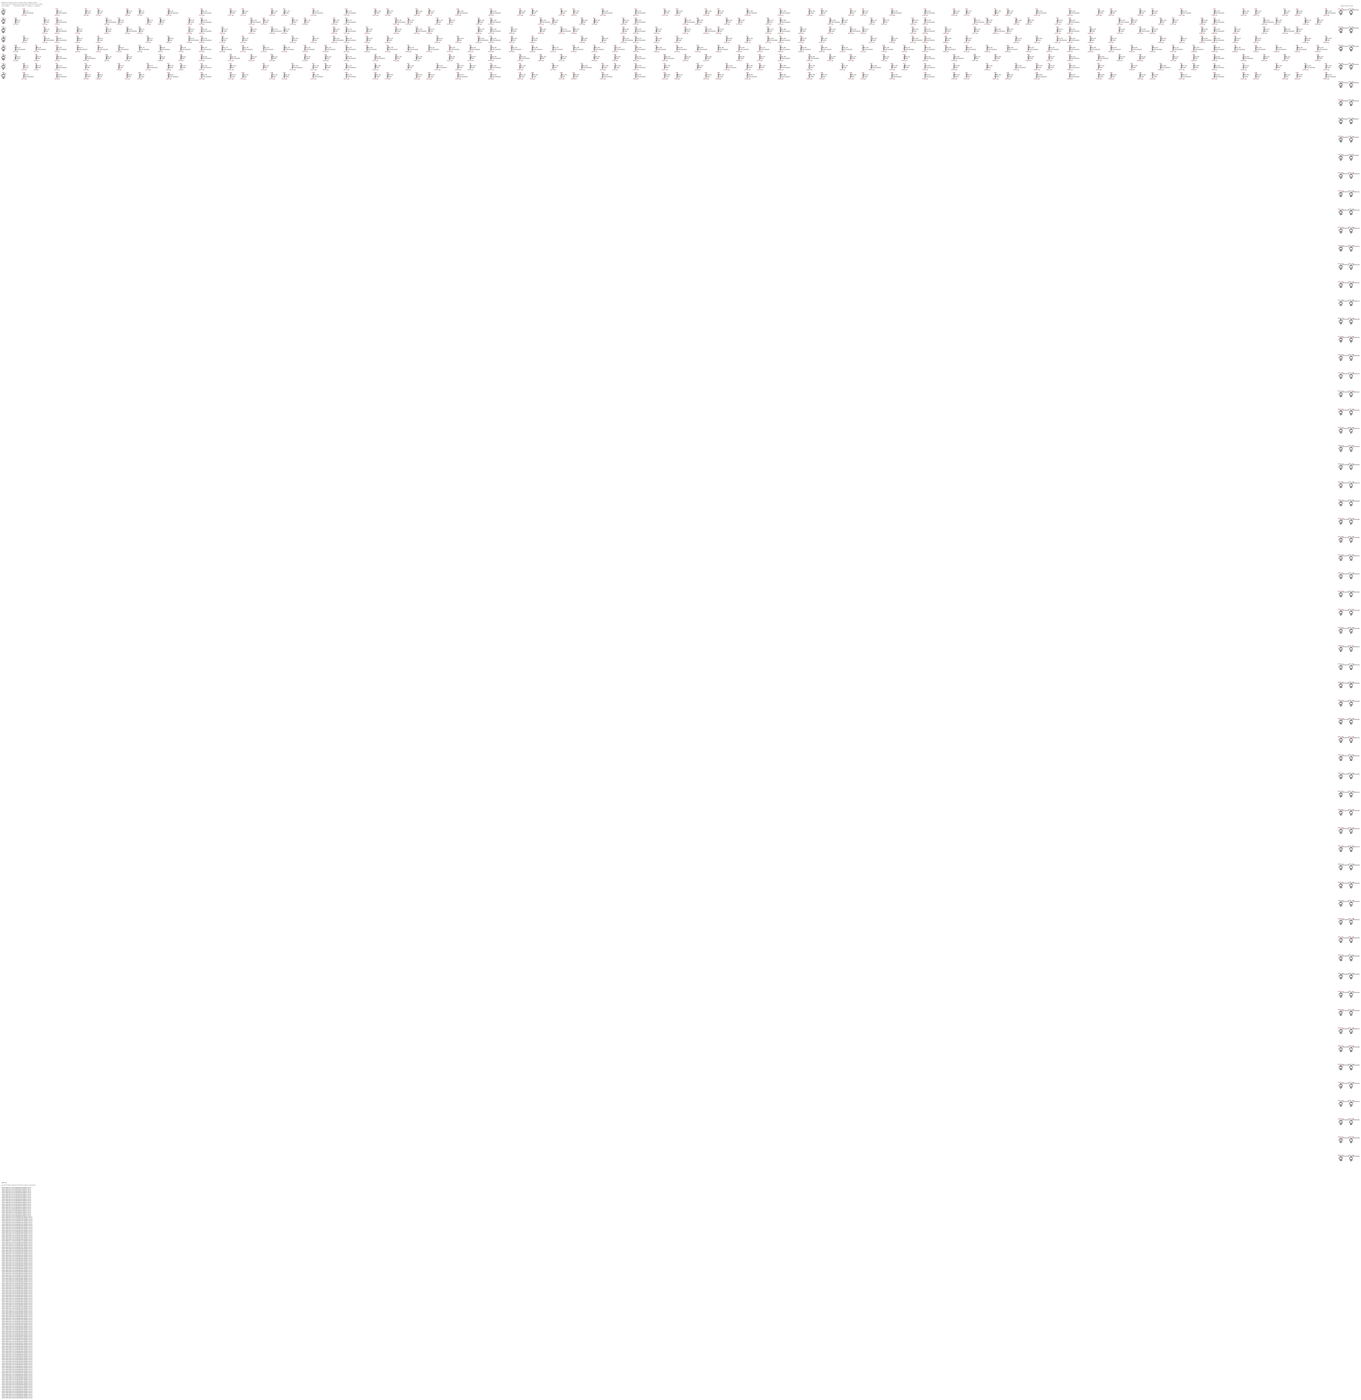
[diagram p0: schematic crossbar_differential.asc, whole sheet]
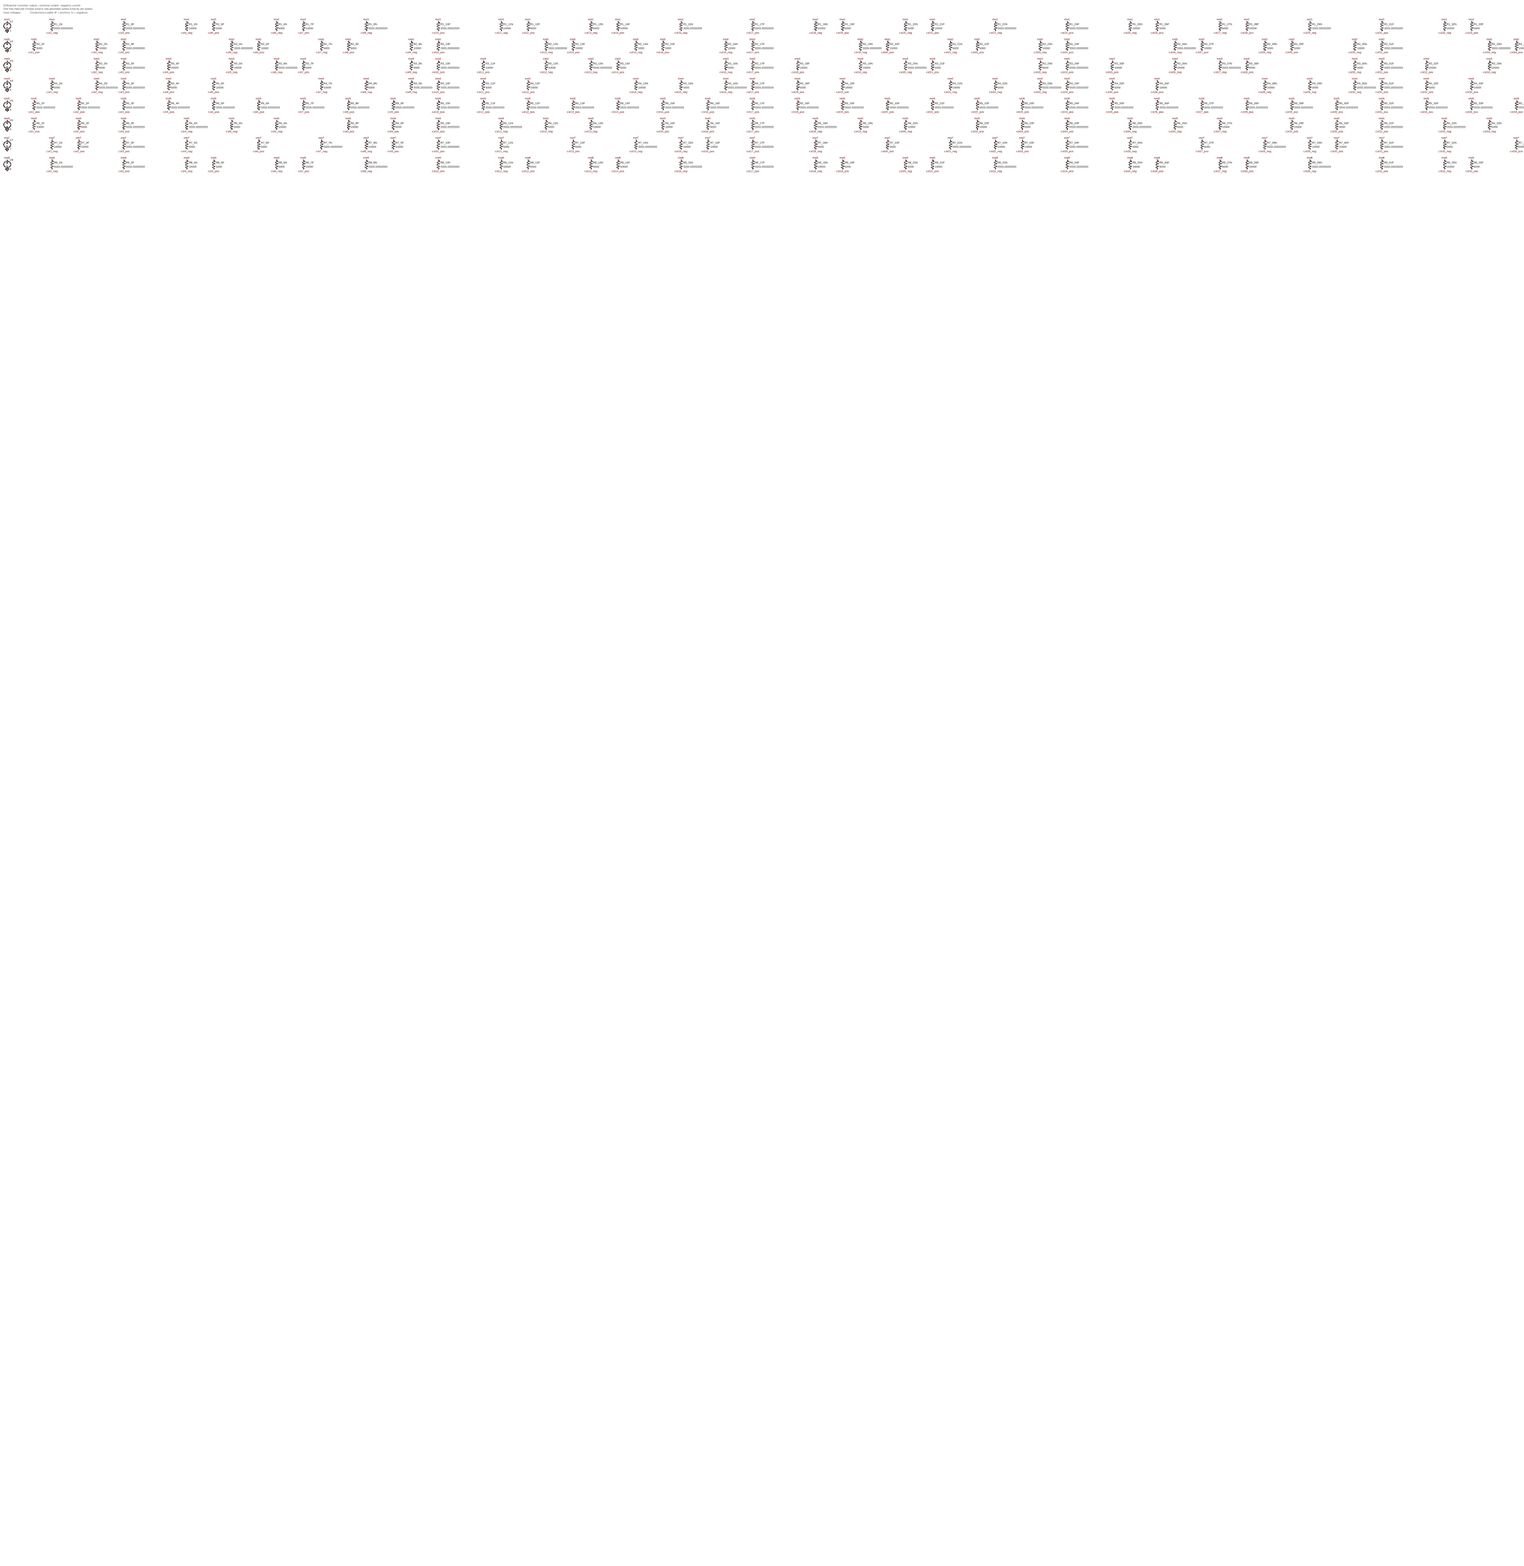
[diagram p1: schematic crossbar_differential.asc, part, row 1 of 2, column 1 of 2]
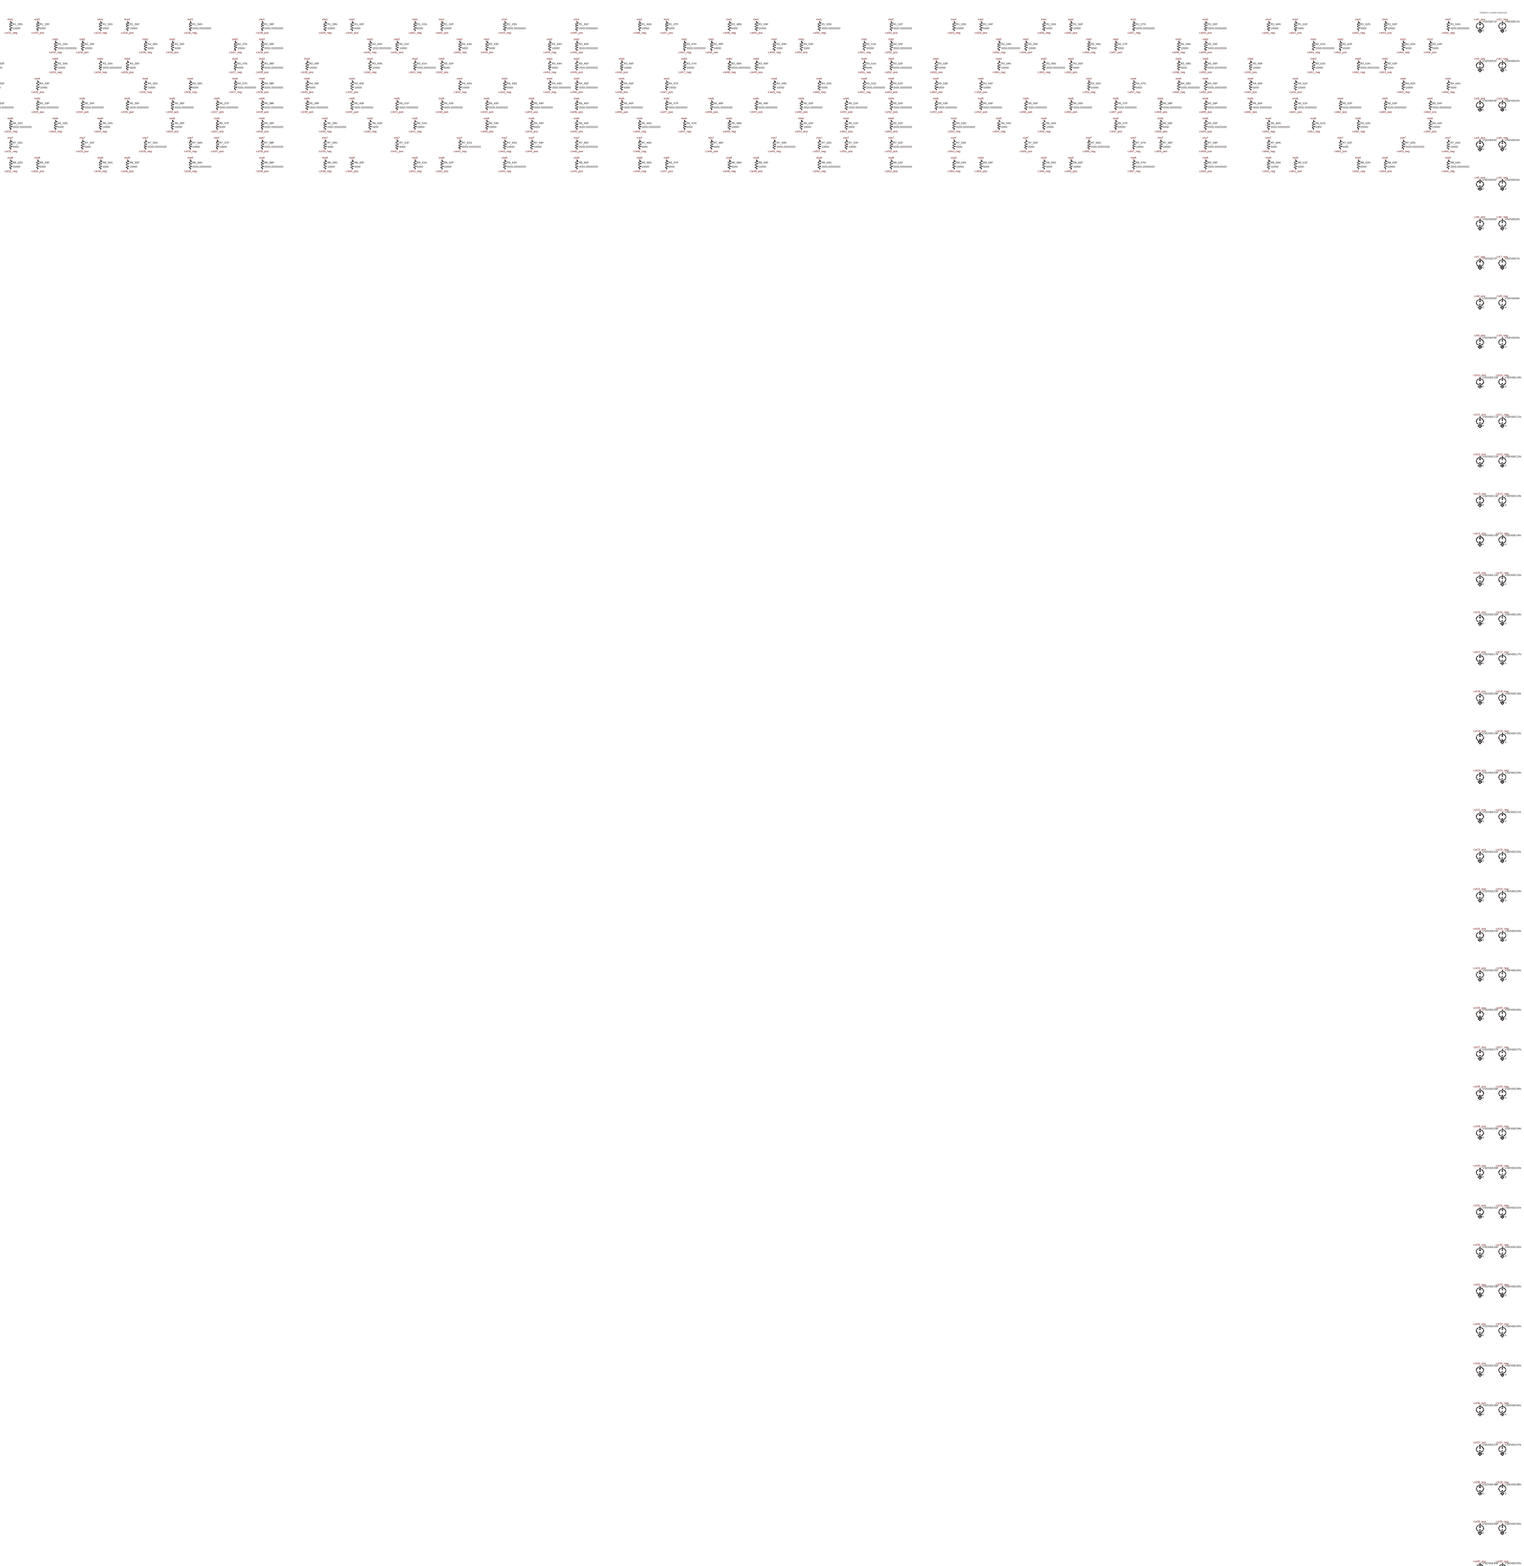
[diagram p2: schematic crossbar_differential.asc, part, row 1 of 2, column 2 of 2]
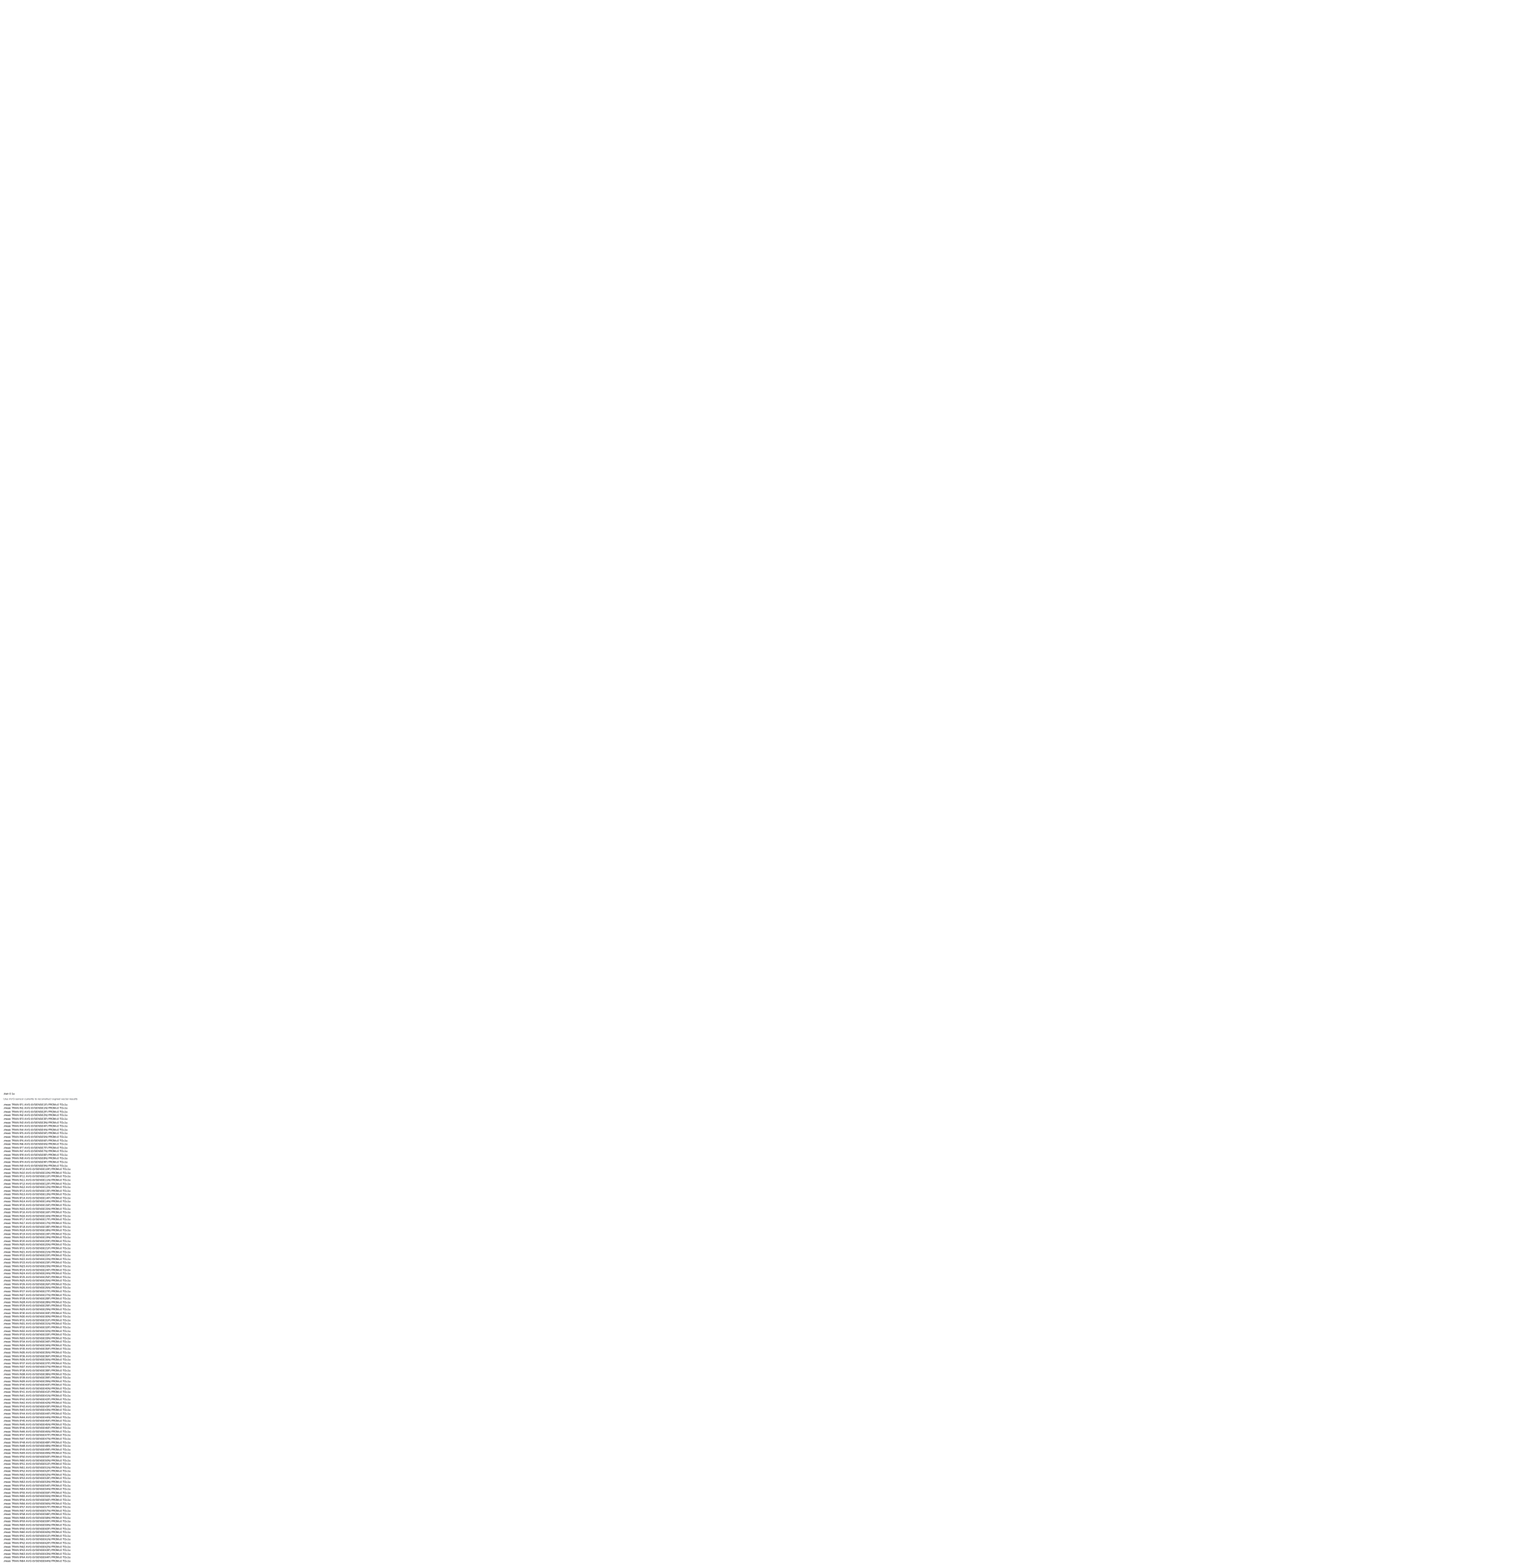
[diagram p3: schematic crossbar_differential.asc, part, row 2 of 2, column 1 of 2]
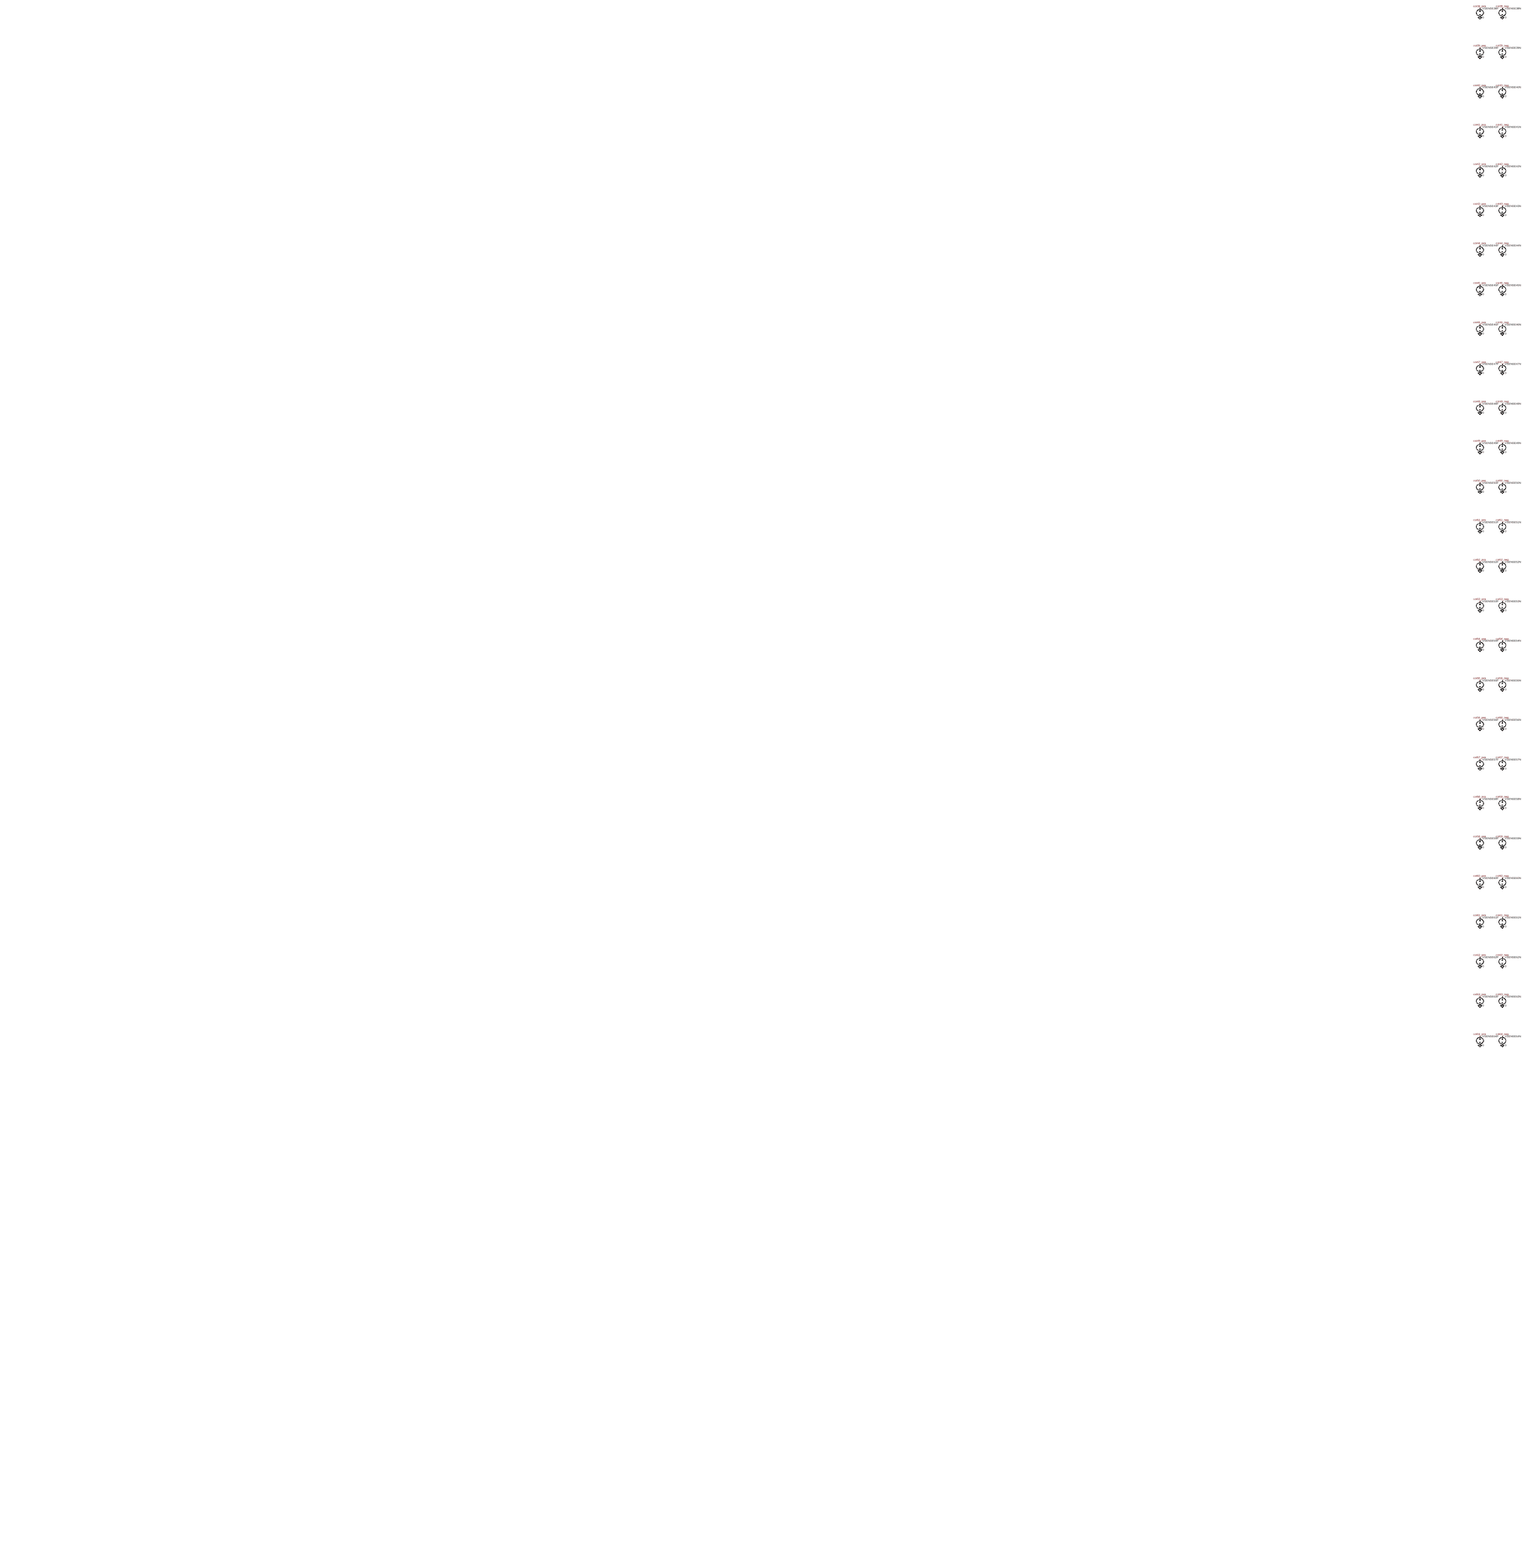
[diagram p4: schematic crossbar_differential.asc, part, row 2 of 2, column 2 of 2]
* crossbar_differential.asc
V1 row1 0 1
V2 row2 0 2
V3 row3 0 3
V4 row4 0 4
V5 row5 0 5
V6 row6 0 6
V7 row7 0 7
V8 row8 0 8
R1_1N row1 col1_neg 3333.33333333
R1_3P row1 col3_pos 3333.33333333
R1_4N row1 col4_neg 10000
R1_5P row1 col5_pos 5000
R1_6N row1 col6_neg 5000
R1_7P row1 col7_pos 10000
R1_8N row1 col8_neg 3333.33333333
R1_10P row1 col10_pos 3333.33333333
R1_11N row1 col11_neg 10000
R1_12P row1 col12_pos 5000
R1_13N row1 col13_neg 5000
R1_14P row1 col14_pos 10000
R1_15N row1 col15_neg 3333.33333333
R1_17P row1 col17_pos 3333.33333333
R1_18N row1 col18_neg 10000
R1_19P row1 col19_pos 5000
R1_20N row1 col20_neg 5000
R1_21P row1 col21_pos 10000
R1_22N row1 col22_neg 3333.33333333
R1_24P row1 col24_pos 3333.33333333
R1_25N row1 col25_neg 10000
R1_26P row1 col26_pos 5000
R1_27N row1 col27_neg 5000
R1_28P row1 col28_pos 10000
R1_29N row1 col29_neg 3333.33333333
R1_31P row1 col31_pos 3333.33333333
R1_32N row1 col32_neg 10000
R1_33P row1 col33_pos 5000
R1_34N row1 col34_neg 5000
R1_35P row1 col35_pos 10000
R1_36N row1 col36_neg 3333.33333333
R1_38P row1 col38_pos 3333.33333333
R1_39N row1 col39_neg 10000
R1_40P row1 col40_pos 5000
R1_41N row1 col41_neg 5000
R1_42P row1 col42_pos 10000
R1_43N row1 col43_neg 3333.33333333
R1_45P row1 col45_pos 3333.33333333
R1_46N row1 col46_neg 10000
R1_47P row1 col47_pos 5000
R1_48N row1 col48_neg 5000
R1_49P row1 col49_pos 10000
R1_50N row1 col50_neg 3333.33333333
R1_52P row1 col52_pos 3333.33333333
R1_53N row1 col53_neg 10000
R1_54P row1 col54_pos 5000
R1_55N row1 col55_neg 5000
R1_56P row1 col56_pos 10000
R1_57N row1 col57_neg 3333.33333333
R1_59P row1 col59_pos 3333.33333333
R1_60N row1 col60_neg 10000
R1_61P row1 col61_pos 5000
R1_62N row1 col62_neg 5000
R1_63P row1 col63_pos 10000
R1_64N row1 col64_neg 3333.33333333
R2_1P row2 col1_pos 5000
R2_2N row2 col2_neg 10000
R2_3P row2 col3_pos 3333.33333333
R2_5N row2 col5_neg 3333.33333333
R2_6P row2 col6_pos 10000
R2_7N row2 col7_neg 5000
R2_8P row2 col8_pos 5000
R2_9N row2 col9_neg 10000
R2_10P row2 col10_pos 3333.33333333
R2_12N row2 col12_neg 3333.33333333
R2_13P row2 col13_pos 10000
R2_14N row2 col14_neg 5000
R2_15P row2 col15_pos 5000
R2_16N row2 col16_neg 10000
R2_17P row2 col17_pos 3333.33333333
R2_19N row2 col19_neg 3333.33333333
R2_20P row2 col20_pos 10000
R2_21N row2 col21_neg 5000
R2_22P row2 col22_pos 5000
R2_23N row2 col23_neg 10000
R2_24P row2 col24_pos 3333.33333333
R2_26N row2 col26_neg 3333.33333333
R2_27P row2 col27_pos 10000
R2_28N row2 col28_neg 5000
R2_29P row2 col29_pos 5000
R2_30N row2 col30_neg 10000
R2_31P row2 col31_pos 3333.33333333
R2_33N row2 col33_neg 3333.33333333
R2_34P row2 col34_pos 10000
R2_35N row2 col35_neg 5000
R2_36P row2 col36_pos 5000
R2_37N row2 col37_neg 10000
R2_38P row2 col38_pos 3333.33333333
R2_40N row2 col40_neg 3333.33333333
R2_41P row2 col41_pos 10000
R2_42N row2 col42_neg 5000
R2_43P row2 col43_pos 5000
R2_44N row2 col44_neg 10000
R2_45P row2 col45_pos 3333.33333333
R2_47N row2 col47_neg 3333.33333333
R2_48P row2 col48_pos 10000
R2_49N row2 col49_neg 5000
R2_50P row2 col50_pos 5000
R2_51N row2 col51_neg 10000
R2_52P row2 col52_pos 3333.33333333
R2_54N row2 col54_neg 3333.33333333
R2_55P row2 col55_pos 10000
R2_56N row2 col56_neg 5000
R2_57P row2 col57_pos 5000
R2_58N row2 col58_neg 10000
R2_59P row2 col59_pos 3333.33333333
R2_61N row2 col61_neg 3333.33333333
R2_62P row2 col62_pos 10000
R2_63N row2 col63_neg 5000
R2_64P row2 col64_pos 5000
R3_2N row3 col2_neg 5000
R3_3P row3 col3_pos 3333.33333333
R3_4P row3 col4_pos 10000
R3_5N row3 col5_neg 10000
R3_6N row3 col6_neg 3333.33333333
R3_7P row3 col7_pos 5000
R3_9N row3 col9_neg 5000
R3_10P row3 col10_pos 3333.33333333
R3_11P row3 col11_pos 10000
R3_12N row3 col12_neg 10000
R3_13N row3 col13_neg 3333.33333333
R3_14P row3 col14_pos 5000
R3_16N row3 col16_neg 5000
R3_17P row3 col17_pos 3333.33333333
R3_18P row3 col18_pos 10000
R3_19N row3 col19_neg 10000
R3_20N row3 col20_neg 3333.33333333
R3_21P row3 col21_pos 5000
R3_23N row3 col23_neg 5000
R3_24P row3 col24_pos 3333.33333333
R3_25P row3 col25_pos 10000
R3_26N row3 col26_neg 10000
R3_27N row3 col27_neg 3333.33333333
R3_28P row3 col28_pos 5000
R3_30N row3 col30_neg 5000
R3_31P row3 col31_pos 3333.33333333
R3_32P row3 col32_pos 10000
R3_33N row3 col33_neg 10000
R3_34N row3 col34_neg 3333.33333333
R3_35P row3 col35_pos 5000
R3_37N row3 col37_neg 5000
R3_38P row3 col38_pos 3333.33333333
R3_39P row3 col39_pos 10000
R3_40N row3 col40_neg 10000
R3_41N row3 col41_neg 3333.33333333
R3_42P row3 col42_pos 5000
R3_44N row3 col44_neg 5000
R3_45P row3 col45_pos 3333.33333333
R3_46P row3 col46_pos 10000
R3_47N row3 col47_neg 10000
R3_48N row3 col48_neg 3333.33333333
R3_49P row3 col49_pos 5000
R3_51N row3 col51_neg 5000
R3_52P row3 col52_pos 3333.33333333
R3_53P row3 col53_pos 10000
R3_54N row3 col54_neg 10000
R3_55N row3 col55_neg 3333.33333333
R3_56P row3 col56_pos 5000
R3_58N row3 col58_neg 5000
R3_59P row3 col59_pos 3333.33333333
R3_60P row3 col60_pos 10000
R3_61N row3 col61_neg 10000
R3_62N row3 col62_neg 3333.33333333
R3_63P row3 col63_pos 5000
R4_1N row4 col1_neg 5000
R4_2N row4 col2_neg 3333.33333333
R4_3P row4 col3_pos 3333.33333333
R4_4P row4 col4_pos 5000
R4_5P row4 col5_pos 10000
R4_7N row4 col7_neg 10000
R4_8N row4 col8_neg 5000
R4_9N row4 col9_neg 3333.33333333
R4_10P row4 col10_pos 3333.33333333
R4_11P row4 col11_pos 5000
R4_12P row4 col12_pos 10000
R4_14N row4 col14_neg 10000
R4_15N row4 col15_neg 5000
R4_16N row4 col16_neg 3333.33333333
R4_17P row4 col17_pos 3333.33333333
R4_18P row4 col18_pos 5000
R4_19P row4 col19_pos 10000
R4_21N row4 col21_neg 10000
R4_22N row4 col22_neg 5000
R4_23N row4 col23_neg 3333.33333333
R4_24P row4 col24_pos 3333.33333333
R4_25P row4 col25_pos 5000
R4_26P row4 col26_pos 10000
R4_28N row4 col28_neg 10000
R4_29N row4 col29_neg 5000
R4_30N row4 col30_neg 3333.33333333
R4_31P row4 col31_pos 3333.33333333
R4_32P row4 col32_pos 5000
R4_33P row4 col33_pos 10000
R4_35N row4 col35_neg 10000
R4_36N row4 col36_neg 5000
R4_37N row4 col37_neg 3333.33333333
R4_38P row4 col38_pos 3333.33333333
R4_39P row4 col39_pos 5000
R4_40P row4 col40_pos 10000
R4_42N row4 col42_neg 10000
R4_43N row4 col43_neg 5000
R4_44N row4 col44_neg 3333.33333333
R4_45P row4 col45_pos 3333.33333333
R4_46P row4 col46_pos 5000
R4_47P row4 col47_pos 10000
R4_49N row4 col49_neg 10000
R4_50N row4 col50_neg 5000
R4_51N row4 col51_neg 3333.33333333
R4_52P row4 col52_pos 3333.33333333
R4_53P row4 col53_pos 5000
R4_54P row4 col54_pos 10000
R4_56N row4 col56_neg 10000
R4_57N row4 col57_neg 5000
R4_58N row4 col58_neg 3333.33333333
R4_59P row4 col59_pos 3333.33333333
R4_60P row4 col60_pos 5000
R4_61P row4 col61_pos 10000
R4_63N row4 col63_neg 10000
R4_64N row4 col64_neg 5000
R5_1P row5 col1_pos 3333.33333333
R5_2P row5 col2_pos 3333.33333333
R5_3P row5 col3_pos 3333.33333333
R5_4P row5 col4_pos 3333.33333333
R5_5P row5 col5_pos 3333.33333333
R5_6P row5 col6_pos 3333.33333333
R5_7P row5 col7_pos 3333.33333333
R5_8P row5 col8_pos 3333.33333333
R5_9P row5 col9_pos 3333.33333333
R5_10P row5 col10_pos 3333.33333333
R5_11P row5 col11_pos 3333.33333333
R5_12P row5 col12_pos 3333.33333333
R5_13P row5 col13_pos 3333.33333333
R5_14P row5 col14_pos 3333.33333333
R5_15P row5 col15_pos 3333.33333333
R5_16P row5 col16_pos 3333.33333333
R5_17P row5 col17_pos 3333.33333333
R5_18P row5 col18_pos 3333.33333333
R5_19P row5 col19_pos 3333.33333333
R5_20P row5 col20_pos 3333.33333333
R5_21P row5 col21_pos 3333.33333333
R5_22P row5 col22_pos 3333.33333333
R5_23P row5 col23_pos 3333.33333333
R5_24P row5 col24_pos 3333.33333333
R5_25P row5 col25_pos 3333.33333333
R5_26P row5 col26_pos 3333.33333333
R5_27P row5 col27_pos 3333.33333333
R5_28P row5 col28_pos 3333.33333333
R5_29P row5 col29_pos 3333.33333333
R5_30P row5 col30_pos 3333.33333333
R5_31P row5 col31_pos 3333.33333333
R5_32P row5 col32_pos 3333.33333333
R5_33P row5 col33_pos 3333.33333333
R5_34P row5 col34_pos 3333.33333333
R5_35P row5 col35_pos 3333.33333333
R5_36P row5 col36_pos 3333.33333333
R5_37P row5 col37_pos 3333.33333333
R5_38P row5 col38_pos 3333.33333333
R5_39P row5 col39_pos 3333.33333333
R5_40P row5 col40_pos 3333.33333333
R5_41P row5 col41_pos 3333.33333333
R5_42P row5 col42_pos 3333.33333333
R5_43P row5 col43_pos 3333.33333333
R5_44P row5 col44_pos 3333.33333333
R5_45P row5 col45_pos 3333.33333333
R5_46P row5 col46_pos 3333.33333333
R5_47P row5 col47_pos 3333.33333333
R5_48P row5 col48_pos 3333.33333333
R5_49P row5 col49_pos 3333.33333333
R5_50P row5 col50_pos 3333.33333333
R5_51P row5 col51_pos 3333.33333333
R5_52P row5 col52_pos 3333.33333333
R5_53P row5 col53_pos 3333.33333333
R5_54P row5 col54_pos 3333.33333333
R5_55P row5 col55_pos 3333.33333333
R5_56P row5 col56_pos 3333.33333333
R5_57P row5 col57_pos 3333.33333333
R5_58P row5 col58_pos 3333.33333333
R5_59P row5 col59_pos 3333.33333333
R5_60P row5 col60_pos 3333.33333333
R5_61P row5 col61_pos 3333.33333333
R5_62P row5 col62_pos 3333.33333333
R5_63P row5 col63_pos 3333.33333333
R5_64P row5 col64_pos 3333.33333333
R6_1P row6 col1_pos 10000
R6_2P row6 col2_pos 5000
R6_3P row6 col3_pos 3333.33333333
R6_4N row6 col4_neg 3333.33333333
R6_5N row6 col5_neg 5000
R6_6N row6 col6_neg 10000
R6_8P row6 col8_pos 10000
R6_9P row6 col9_pos 5000
R6_10P row6 col10_pos 3333.33333333
R6_11N row6 col11_neg 3333.33333333
R6_12N row6 col12_neg 5000
R6_13N row6 col13_neg 10000
R6_15P row6 col15_pos 10000
R6_16P row6 col16_pos 5000
R6_17P row6 col17_pos 3333.33333333
R6_18N row6 col18_neg 3333.33333333
R6_19N row6 col19_neg 5000
R6_20N row6 col20_neg 10000
R6_22P row6 col22_pos 10000
R6_23P row6 col23_pos 5000
R6_24P row6 col24_pos 3333.33333333
R6_25N row6 col25_neg 3333.33333333
R6_26N row6 col26_neg 5000
R6_27N row6 col27_neg 10000
R6_29P row6 col29_pos 10000
R6_30P row6 col30_pos 5000
R6_31P row6 col31_pos 3333.33333333
R6_32N row6 col32_neg 3333.33333333
R6_33N row6 col33_neg 5000
R6_34N row6 col34_neg 10000
R6_36P row6 col36_pos 10000
R6_37P row6 col37_pos 5000
R6_38P row6 col38_pos 3333.33333333
R6_39N row6 col39_neg 3333.33333333
R6_40N row6 col40_neg 5000
R6_41N row6 col41_neg 10000
R6_43P row6 col43_pos 10000
R6_44P row6 col44_pos 5000
R6_45P row6 col45_pos 3333.33333333
R6_46N row6 col46_neg 3333.33333333
R6_47N row6 col47_neg 5000
R6_48N row6 col48_neg 10000
R6_50P row6 col50_pos 10000
R6_51P row6 col51_pos 5000
R6_52P row6 col52_pos 3333.33333333
R6_53N row6 col53_neg 3333.33333333
R6_54N row6 col54_neg 5000
R6_55N row6 col55_neg 10000
R6_57P row6 col57_pos 10000
R6_58P row6 col58_pos 5000
R6_59P row6 col59_pos 3333.33333333
R6_60N row6 col60_neg 3333.33333333
R6_61N row6 col61_neg 5000
R6_62N row6 col62_neg 10000
R6_64P row6 col64_pos 10000
R7_1N row7 col1_neg 10000
R7_2P row7 col2_pos 10000
R7_3P row7 col3_pos 3333.33333333
R7_4N row7 col4_neg 5000
R7_6P row7 col6_pos 5000
R7_7N row7 col7_neg 3333.33333333
R7_8N row7 col8_neg 10000
R7_9P row7 col9_pos 10000
R7_10P row7 col10_pos 3333.33333333
R7_11N row7 col11_neg 5000
R7_13P row7 col13_pos 5000
R7_14N row7 col14_neg 3333.33333333
R7_15N row7 col15_neg 10000
R7_16P row7 col16_pos 10000
R7_17P row7 col17_pos 3333.33333333
R7_18N row7 col18_neg 5000
R7_20P row7 col20_pos 5000
R7_21N row7 col21_neg 3333.33333333
R7_22N row7 col22_neg 10000
R7_23P row7 col23_pos 10000
R7_24P row7 col24_pos 3333.33333333
R7_25N row7 col25_neg 5000
R7_27P row7 col27_pos 5000
R7_28N row7 col28_neg 3333.33333333
R7_29N row7 col29_neg 10000
R7_30P row7 col30_pos 10000
R7_31P row7 col31_pos 3333.33333333
R7_32N row7 col32_neg 5000
R7_34P row7 col34_pos 5000
R7_35N row7 col35_neg 3333.33333333
R7_36N row7 col36_neg 10000
R7_37P row7 col37_pos 10000
R7_38P row7 col38_pos 3333.33333333
R7_39N row7 col39_neg 5000
R7_41P row7 col41_pos 5000
R7_42N row7 col42_neg 3333.33333333
R7_43N row7 col43_neg 10000
R7_44P row7 col44_pos 10000
R7_45P row7 col45_pos 3333.33333333
R7_46N row7 col46_neg 5000
R7_48P row7 col48_pos 5000
R7_49N row7 col49_neg 3333.33333333
R7_50N row7 col50_neg 10000
R7_51P row7 col51_pos 10000
R7_52P row7 col52_pos 3333.33333333
R7_53N row7 col53_neg 5000
R7_55P row7 col55_pos 5000
R7_56N row7 col56_neg 3333.33333333
R7_57N row7 col57_neg 10000
R7_58P row7 col58_pos 10000
R7_59P row7 col59_pos 3333.33333333
R7_60N row7 col60_neg 5000
R7_62P row7 col62_pos 5000
R7_63N row7 col63_neg 3333.33333333
R7_64N row7 col64_neg 10000
R8_1N row8 col1_neg 3333.33333333
R8_3P row8 col3_pos 3333.33333333
R8_4N row8 col4_neg 10000
R8_5P row8 col5_pos 5000
R8_6N row8 col6_neg 5000
R8_7P row8 col7_pos 10000
R8_8N row8 col8_neg 3333.33333333
R8_10P row8 col10_pos 3333.33333333
R8_11N row8 col11_neg 10000
R8_12P row8 col12_pos 5000
R8_13N row8 col13_neg 5000
R8_14P row8 col14_pos 10000
R8_15N row8 col15_neg 3333.33333333
R8_17P row8 col17_pos 3333.33333333
R8_18N row8 col18_neg 10000
R8_19P row8 col19_pos 5000
R8_20N row8 col20_neg 5000
R8_21P row8 col21_pos 10000
R8_22N row8 col22_neg 3333.33333333
R8_24P row8 col24_pos 3333.33333333
R8_25N row8 col25_neg 10000
R8_26P row8 col26_pos 5000
R8_27N row8 col27_neg 5000
R8_28P row8 col28_pos 10000
R8_29N row8 col29_neg 3333.33333333
R8_31P row8 col31_pos 3333.33333333
R8_32N row8 col32_neg 10000
R8_33P row8 col33_pos 5000
R8_34N row8 col34_neg 5000
R8_35P row8 col35_pos 10000
R8_36N row8 col36_neg 3333.33333333
R8_38P row8 col38_pos 3333.33333333
R8_39N row8 col39_neg 10000
R8_40P row8 col40_pos 5000
R8_41N row8 col41_neg 5000
R8_42P row8 col42_pos 10000
R8_43N row8 col43_neg 3333.33333333
R8_45P row8 col45_pos 3333.33333333
R8_46N row8 col46_neg 10000
R8_47P row8 col47_pos 5000
R8_48N row8 col48_neg 5000
R8_49P row8 col49_pos 10000
R8_50N row8 col50_neg 3333.33333333
R8_52P row8 col52_pos 3333.33333333
R8_53N row8 col53_neg 10000
R8_54P row8 col54_pos 5000
R8_55N row8 col55_neg 5000
R8_56P row8 col56_pos 10000
R8_57N row8 col57_neg 3333.33333333
R8_59P row8 col59_pos 3333.33333333
R8_60N row8 col60_neg 10000
R8_61P row8 col61_pos 5000
R8_62N row8 col62_neg 5000
R8_63P row8 col63_pos 10000
R8_64N row8 col64_neg 3333.33333333
VSENSE1P col1_pos 0 0
VSENSE1N col1_neg 0 0
VSENSE2P col2_pos 0 0
VSENSE2N col2_neg 0 0
VSENSE3P col3_pos 0 0
VSENSE3N col3_neg 0 0
VSENSE4P col4_pos 0 0
VSENSE4N col4_neg 0 0
VSENSE5P col5_pos 0 0
VSENSE5N col5_neg 0 0
VSENSE6P col6_pos 0 0
VSENSE6N col6_neg 0 0
VSENSE7P col7_pos 0 0
VSENSE7N col7_neg 0 0
VSENSE8P col8_pos 0 0
VSENSE8N col8_neg 0 0
VSENSE9P col9_pos 0 0
VSENSE9N col9_neg 0 0
VSENSE10P col10_pos 0 0
VSENSE10N col10_neg 0 0
VSENSE11P col11_pos 0 0
VSENSE11N col11_neg 0 0
VSENSE12P col12_pos 0 0
VSENSE12N col12_neg 0 0
VSENSE13P col13_pos 0 0
VSENSE13N col13_neg 0 0
VSENSE14P col14_pos 0 0
VSENSE14N col14_neg 0 0
VSENSE15P col15_pos 0 0
VSENSE15N col15_neg 0 0
VSENSE16P col16_pos 0 0
VSENSE16N col16_neg 0 0
VSENSE17P col17_pos 0 0
VSENSE17N col17_neg 0 0
VSENSE18P col18_pos 0 0
VSENSE18N col18_neg 0 0
VSENSE19P col19_pos 0 0
VSENSE19N col19_neg 0 0
VSENSE20P col20_pos 0 0
VSENSE20N col20_neg 0 0
VSENSE21P col21_pos 0 0
VSENSE21N col21_neg 0 0
VSENSE22P col22_pos 0 0
VSENSE22N col22_neg 0 0
VSENSE23P col23_pos 0 0
VSENSE23N col23_neg 0 0
VSENSE24P col24_pos 0 0
VSENSE24N col24_neg 0 0
VSENSE25P col25_pos 0 0
VSENSE25N col25_neg 0 0
VSENSE26P col26_pos 0 0
VSENSE26N col26_neg 0 0
VSENSE27P col27_pos 0 0
VSENSE27N col27_neg 0 0
VSENSE28P col28_pos 0 0
VSENSE28N col28_neg 0 0
VSENSE29P col29_pos 0 0
VSENSE29N col29_neg 0 0
VSENSE30P col30_pos 0 0
VSENSE30N col30_neg 0 0
VSENSE31P col31_pos 0 0
VSENSE31N col31_neg 0 0
VSENSE32P col32_pos 0 0
VSENSE32N col32_neg 0 0
VSENSE33P col33_pos 0 0
VSENSE33N col33_neg 0 0
VSENSE34P col34_pos 0 0
VSENSE34N col34_neg 0 0
VSENSE35P col35_pos 0 0
VSENSE35N col35_neg 0 0
VSENSE36P col36_pos 0 0
VSENSE36N col36_neg 0 0
VSENSE37P col37_pos 0 0
VSENSE37N col37_neg 0 0
VSENSE38P col38_pos 0 0
VSENSE38N col38_neg 0 0
VSENSE39P col39_pos 0 0
VSENSE39N col39_neg 0 0
VSENSE40P col40_pos 0 0
VSENSE40N col40_neg 0 0
VSENSE41P col41_pos 0 0
VSENSE41N col41_neg 0 0
VSENSE42P col42_pos 0 0
VSENSE42N col42_neg 0 0
VSENSE43P col43_pos 0 0
VSENSE43N col43_neg 0 0
VSENSE44P col44_pos 0 0
VSENSE44N col44_neg 0 0
VSENSE45P col45_pos 0 0
VSENSE45N col45_neg 0 0
VSENSE46P col46_pos 0 0
VSENSE46N col46_neg 0 0
VSENSE47P col47_pos 0 0
VSENSE47N col47_neg 0 0
VSENSE48P col48_pos 0 0
VSENSE48N col48_neg 0 0
VSENSE49P col49_pos 0 0
VSENSE49N col49_neg 0 0
VSENSE50P col50_pos 0 0
VSENSE50N col50_neg 0 0
VSENSE51P col51_pos 0 0
VSENSE51N col51_neg 0 0
VSENSE52P col52_pos 0 0
VSENSE52N col52_neg 0 0
VSENSE53P col53_pos 0 0
VSENSE53N col53_neg 0 0
VSENSE54P col54_pos 0 0
VSENSE54N col54_neg 0 0
VSENSE55P col55_pos 0 0
VSENSE55N col55_neg 0 0
VSENSE56P col56_pos 0 0
VSENSE56N col56_neg 0 0
VSENSE57P col57_pos 0 0
VSENSE57N col57_neg 0 0
VSENSE58P col58_pos 0 0
VSENSE58N col58_neg 0 0
VSENSE59P col59_pos 0 0
VSENSE59N col59_neg 0 0
VSENSE60P col60_pos 0 0
VSENSE60N col60_neg 0 0
VSENSE61P col61_pos 0 0
VSENSE61N col61_neg 0 0
VSENSE62P col62_pos 0 0
VSENSE62N col62_neg 0 0
VSENSE63P col63_pos 0 0
VSENSE63N col63_neg 0 0
VSENSE64P col64_pos 0 0
VSENSE64N col64_neg 0 0
* Differential crossbar: output = positive current - negative current
* One row input per voltage source; two grounded sense sources per output
* Input voltages
* Conductance paths (P = positive, N = negative)
* Output current sensors
.tran 0 1u
* Use AVG sensor currents to reconstruct signed vector results
.meas TRAN IP1 AVG I(VSENSE1P) FROM=0 TO=1u
.meas TRAN IN1 AVG I(VSENSE1N) FROM=0 TO=1u
.meas TRAN IP2 AVG I(VSENSE2P) FROM=0 TO=1u
.meas TRAN IN2 AVG I(VSENSE2N) FROM=0 TO=1u
.meas TRAN IP3 AVG I(VSENSE3P) FROM=0 TO=1u
.meas TRAN IN3 AVG I(VSENSE3N) FROM=0 TO=1u
.meas TRAN IP4 AVG I(VSENSE4P) FROM=0 TO=1u
.meas TRAN IN4 AVG I(VSENSE4N) FROM=0 TO=1u
.meas TRAN IP5 AVG I(VSENSE5P) FROM=0 TO=1u
.meas TRAN IN5 AVG I(VSENSE5N) FROM=0 TO=1u
.meas TRAN IP6 AVG I(VSENSE6P) FROM=0 TO=1u
.meas TRAN IN6 AVG I(VSENSE6N) FROM=0 TO=1u
.meas TRAN IP7 AVG I(VSENSE7P) FROM=0 TO=1u
.meas TRAN IN7 AVG I(VSENSE7N) FROM=0 TO=1u
.meas TRAN IP8 AVG I(VSENSE8P) FROM=0 TO=1u
.meas TRAN IN8 AVG I(VSENSE8N) FROM=0 TO=1u
.meas TRAN IP9 AVG I(VSENSE9P) FROM=0 TO=1u
.meas TRAN IN9 AVG I(VSENSE9N) FROM=0 TO=1u
.meas TRAN IP10 AVG I(VSENSE10P) FROM=0 TO=1u
.meas TRAN IN10 AVG I(VSENSE10N) FROM=0 TO=1u
.meas TRAN IP11 AVG I(VSENSE11P) FROM=0 TO=1u
.meas TRAN IN11 AVG I(VSENSE11N) FROM=0 TO=1u
.meas TRAN IP12 AVG I(VSENSE12P) FROM=0 TO=1u
.meas TRAN IN12 AVG I(VSENSE12N) FROM=0 TO=1u
.meas TRAN IP13 AVG I(VSENSE13P) FROM=0 TO=1u
.meas TRAN IN13 AVG I(VSENSE13N) FROM=0 TO=1u
.meas TRAN IP14 AVG I(VSENSE14P) FROM=0 TO=1u
.meas TRAN IN14 AVG I(VSENSE14N) FROM=0 TO=1u
.meas TRAN IP15 AVG I(VSENSE15P) FROM=0 TO=1u
.meas TRAN IN15 AVG I(VSENSE15N) FROM=0 TO=1u
.meas TRAN IP16 AVG I(VSENSE16P) FROM=0 TO=1u
.meas TRAN IN16 AVG I(VSENSE16N) FROM=0 TO=1u
.meas TRAN IP17 AVG I(VSENSE17P) FROM=0 TO=1u
.meas TRAN IN17 AVG I(VSENSE17N) FROM=0 TO=1u
.meas TRAN IP18 AVG I(VSENSE18P) FROM=0 TO=1u
.meas TRAN IN18 AVG I(VSENSE18N) FROM=0 TO=1u
.meas TRAN IP19 AVG I(VSENSE19P) FROM=0 TO=1u
.meas TRAN IN19 AVG I(VSENSE19N) FROM=0 TO=1u
.meas TRAN IP20 AVG I(VSENSE20P) FROM=0 TO=1u
.meas TRAN IN20 AVG I(VSENSE20N) FROM=0 TO=1u
.meas TRAN IP21 AVG I(VSENSE21P) FROM=0 TO=1u
.meas TRAN IN21 AVG I(VSENSE21N) FROM=0 TO=1u
.meas TRAN IP22 AVG I(VSENSE22P) FROM=0 TO=1u
.meas TRAN IN22 AVG I(VSENSE22N) FROM=0 TO=1u
.meas TRAN IP23 AVG I(VSENSE23P) FROM=0 TO=1u
.meas TRAN IN23 AVG I(VSENSE23N) FROM=0 TO=1u
.meas TRAN IP24 AVG I(VSENSE24P) FROM=0 TO=1u
.meas TRAN IN24 AVG I(VSENSE24N) FROM=0 TO=1u
.meas TRAN IP25 AVG I(VSENSE25P) FROM=0 TO=1u
.meas TRAN IN25 AVG I(VSENSE25N) FROM=0 TO=1u
.meas TRAN IP26 AVG I(VSENSE26P) FROM=0 TO=1u
.meas TRAN IN26 AVG I(VSENSE26N) FROM=0 TO=1u
.meas TRAN IP27 AVG I(VSENSE27P) FROM=0 TO=1u
.meas TRAN IN27 AVG I(VSENSE27N) FROM=0 TO=1u
.meas TRAN IP28 AVG I(VSENSE28P) FROM=0 TO=1u
.meas TRAN IN28 AVG I(VSENSE28N) FROM=0 TO=1u
.meas TRAN IP29 AVG I(VSENSE29P) FROM=0 TO=1u
.meas TRAN IN29 AVG I(VSENSE29N) FROM=0 TO=1u
.meas TRAN IP30 AVG I(VSENSE30P) FROM=0 TO=1u
.meas TRAN IN30 AVG I(VSENSE30N) FROM=0 TO=1u
.meas TRAN IP31 AVG I(VSENSE31P) FROM=0 TO=1u
.meas TRAN IN31 AVG I(VSENSE31N) FROM=0 TO=1u
.meas TRAN IP32 AVG I(VSENSE32P) FROM=0 TO=1u
.meas TRAN IN32 AVG I(VSENSE32N) FROM=0 TO=1u
.meas TRAN IP33 AVG I(VSENSE33P) FROM=0 TO=1u
.meas TRAN IN33 AVG I(VSENSE33N) FROM=0 TO=1u
.meas TRAN IP34 AVG I(VSENSE34P) FROM=0 TO=1u
.meas TRAN IN34 AVG I(VSENSE34N) FROM=0 TO=1u
.meas TRAN IP35 AVG I(VSENSE35P) FROM=0 TO=1u
.meas TRAN IN35 AVG I(VSENSE35N) FROM=0 TO=1u
.meas TRAN IP36 AVG I(VSENSE36P) FROM=0 TO=1u
.meas TRAN IN36 AVG I(VSENSE36N) FROM=0 TO=1u
.meas TRAN IP37 AVG I(VSENSE37P) FROM=0 TO=1u
.meas TRAN IN37 AVG I(VSENSE37N) FROM=0 TO=1u
.meas TRAN IP38 AVG I(VSENSE38P) FROM=0 TO=1u
.meas TRAN IN38 AVG I(VSENSE38N) FROM=0 TO=1u
.meas TRAN IP39 AVG I(VSENSE39P) FROM=0 TO=1u
.meas TRAN IN39 AVG I(VSENSE39N) FROM=0 TO=1u
.meas TRAN IP40 AVG I(VSENSE40P) FROM=0 TO=1u
.meas TRAN IN40 AVG I(VSENSE40N) FROM=0 TO=1u
.meas TRAN IP41 AVG I(VSENSE41P) FROM=0 TO=1u
.meas TRAN IN41 AVG I(VSENSE41N) FROM=0 TO=1u
.meas TRAN IP42 AVG I(VSENSE42P) FROM=0 TO=1u
.meas TRAN IN42 AVG I(VSENSE42N) FROM=0 TO=1u
.meas TRAN IP43 AVG I(VSENSE43P) FROM=0 TO=1u
.meas TRAN IN43 AVG I(VSENSE43N) FROM=0 TO=1u
.meas TRAN IP44 AVG I(VSENSE44P) FROM=0 TO=1u
.meas TRAN IN44 AVG I(VSENSE44N) FROM=0 TO=1u
.meas TRAN IP45 AVG I(VSENSE45P) FROM=0 TO=1u
.meas TRAN IN45 AVG I(VSENSE45N) FROM=0 TO=1u
.meas TRAN IP46 AVG I(VSENSE46P) FROM=0 TO=1u
.meas TRAN IN46 AVG I(VSENSE46N) FROM=0 TO=1u
.meas TRAN IP47 AVG I(VSENSE47P) FROM=0 TO=1u
.meas TRAN IN47 AVG I(VSENSE47N) FROM=0 TO=1u
.meas TRAN IP48 AVG I(VSENSE48P) FROM=0 TO=1u
.meas TRAN IN48 AVG I(VSENSE48N) FROM=0 TO=1u
.meas TRAN IP49 AVG I(VSENSE49P) FROM=0 TO=1u
.meas TRAN IN49 AVG I(VSENSE49N) FROM=0 TO=1u
.meas TRAN IP50 AVG I(VSENSE50P) FROM=0 TO=1u
.meas TRAN IN50 AVG I(VSENSE50N) FROM=0 TO=1u
.meas TRAN IP51 AVG I(VSENSE51P) FROM=0 TO=1u
.meas TRAN IN51 AVG I(VSENSE51N) FROM=0 TO=1u
.meas TRAN IP52 AVG I(VSENSE52P) FROM=0 TO=1u
.meas TRAN IN52 AVG I(VSENSE52N) FROM=0 TO=1u
.meas TRAN IP53 AVG I(VSENSE53P) FROM=0 TO=1u
.meas TRAN IN53 AVG I(VSENSE53N) FROM=0 TO=1u
.meas TRAN IP54 AVG I(VSENSE54P) FROM=0 TO=1u
.meas TRAN IN54 AVG I(VSENSE54N) FROM=0 TO=1u
.meas TRAN IP55 AVG I(VSENSE55P) FROM=0 TO=1u
.meas TRAN IN55 AVG I(VSENSE55N) FROM=0 TO=1u
.meas TRAN IP56 AVG I(VSENSE56P) FROM=0 TO=1u
.meas TRAN IN56 AVG I(VSENSE56N) FROM=0 TO=1u
.meas TRAN IP57 AVG I(VSENSE57P) FROM=0 TO=1u
.meas TRAN IN57 AVG I(VSENSE57N) FROM=0 TO=1u
.meas TRAN IP58 AVG I(VSENSE58P) FROM=0 TO=1u
.meas TRAN IN58 AVG I(VSENSE58N) FROM=0 TO=1u
.meas TRAN IP59 AVG I(VSENSE59P) FROM=0 TO=1u
.meas TRAN IN59 AVG I(VSENSE59N) FROM=0 TO=1u
.meas TRAN IP60 AVG I(VSENSE60P) FROM=0 TO=1u
.meas TRAN IN60 AVG I(VSENSE60N) FROM=0 TO=1u
.meas TRAN IP61 AVG I(VSENSE61P) FROM=0 TO=1u
.meas TRAN IN61 AVG I(VSENSE61N) FROM=0 TO=1u
.meas TRAN IP62 AVG I(VSENSE62P) FROM=0 TO=1u
.meas TRAN IN62 AVG I(VSENSE62N) FROM=0 TO=1u
.meas TRAN IP63 AVG I(VSENSE63P) FROM=0 TO=1u
.meas TRAN IN63 AVG I(VSENSE63N) FROM=0 TO=1u
.meas TRAN IP64 AVG I(VSENSE64P) FROM=0 TO=1u
.meas TRAN IN64 AVG I(VSENSE64N) FROM=0 TO=1u
.backanno
.end

* Results of the author's LTspice run, read from the files saved beside the schematic
* From the log:
*   ip1: AVG(I(VSENSE1P))=0.00249999994412 FROM 0 TO 1e-06
*   in1: AVG(I(VSENSE1N))=0.00419999985024 FROM 0 TO 1e-06
*   ip2: AVG(I(VSENSE2P))=0.00340000004507 FROM 0 TO 1e-06
*   in2: AVG(I(VSENSE2N))=0.00200000009499 FROM 0 TO 1e-06
*   ip3: AVG(I(VSENSE3P))=0.0108000002801 FROM 0 TO 1e-06
*   in3: AVG(I(VSENSE3N))=0 FROM 0 TO 1e-06
*   ip4: AVG(I(VSENSE4P))=0.00260000000708 FROM 0 TO 1e-06
*   in4: AVG(I(VSENSE4N))=0.00410000002011 FROM 0 TO 1e-06
*   ip5: AVG(I(VSENSE5P))=0.00370000000112 FROM 0 TO 1e-06
*   in5: AVG(I(VSENSE5N))=0.00209999992512 FROM 0 TO 1e-06
*   ip6: AVG(I(VSENSE6P))=0.00310000008903 FROM 0 TO 1e-06
*   in6: AVG(I(VSENSE6N))=0.00329999998212 FROM 0 TO 1e-06
*   ip7: AVG(I(VSENSE7P))=0.00300000002608 FROM 0 TO 1e-06
*   in7: AVG(I(VSENSE7N))=0.00289999996312 FROM 0 TO 1e-06
*   ip8: AVG(I(VSENSE8P))=0.00249999994412 FROM 0 TO 1e-06
*   in8: AVG(I(VSENSE8N))=0.00419999985024 FROM 0 TO 1e-06
*   ip9: AVG(I(VSENSE9P))=0.00340000004507 FROM 0 TO 1e-06
*   in9: AVG(I(VSENSE9N))=0.00200000009499 FROM 0 TO 1e-06
*   ip10: AVG(I(VSENSE10P))=0.0108000002801 FROM 0 TO 1e-06
*   in10: AVG(I(VSENSE10N))=0 FROM 0 TO 1e-06
*   ip11: AVG(I(VSENSE11P))=0.00260000000708 FROM 0 TO 1e-06
*   in11: AVG(I(VSENSE11N))=0.00410000002011 FROM 0 TO 1e-06
*   ip12: AVG(I(VSENSE12P))=0.00370000000112 FROM 0 TO 1e-06
*   in12: AVG(I(VSENSE12N))=0.00209999992512 FROM 0 TO 1e-06
*   ip13: AVG(I(VSENSE13P))=0.00310000008903 FROM 0 TO 1e-06
*   in13: AVG(I(VSENSE13N))=0.00329999998212 FROM 0 TO 1e-06
*   ip14: AVG(I(VSENSE14P))=0.00300000002608 FROM 0 TO 1e-06
*   in14: AVG(I(VSENSE14N))=0.00289999996312 FROM 0 TO 1e-06
*   ip15: AVG(I(VSENSE15P))=0.00249999994412 FROM 0 TO 1e-06
*   in15: AVG(I(VSENSE15N))=0.00419999985024 FROM 0 TO 1e-06
*   ip16: AVG(I(VSENSE16P))=0.00340000004507 FROM 0 TO 1e-06
*   in16: AVG(I(VSENSE16N))=0.00200000009499 FROM 0 TO 1e-06
*   ip17: AVG(I(VSENSE17P))=0.0108000002801 FROM 0 TO 1e-06
*   in17: AVG(I(VSENSE17N))=0 FROM 0 TO 1e-06
*   ip18: AVG(I(VSENSE18P))=0.00260000000708 FROM 0 TO 1e-06
*   in18: AVG(I(VSENSE18N))=0.00410000002011 FROM 0 TO 1e-06
*   ip19: AVG(I(VSENSE19P))=0.00370000000112 FROM 0 TO 1e-06
*   in19: AVG(I(VSENSE19N))=0.00209999992512 FROM 0 TO 1e-06
*   ip20: AVG(I(VSENSE20P))=0.00310000008903 FROM 0 TO 1e-06
*   in20: AVG(I(VSENSE20N))=0.00329999998212 FROM 0 TO 1e-06
*   ip21: AVG(I(VSENSE21P))=0.00300000002608 FROM 0 TO 1e-06
*   in21: AVG(I(VSENSE21N))=0.00289999996312 FROM 0 TO 1e-06
*   ip22: AVG(I(VSENSE22P))=0.00249999994412 FROM 0 TO 1e-06
*   in22: AVG(I(VSENSE22N))=0.00419999985024 FROM 0 TO 1e-06
*   ip23: AVG(I(VSENSE23P))=0.00340000004507 FROM 0 TO 1e-06
*   in23: AVG(I(VSENSE23N))=0.00200000009499 FROM 0 TO 1e-06
*   ip24: AVG(I(VSENSE24P))=0.0108000002801 FROM 0 TO 1e-06
*   in24: AVG(I(VSENSE24N))=0 FROM 0 TO 1e-06
*   ip25: AVG(I(VSENSE25P))=0.00260000000708 FROM 0 TO 1e-06
*   in25: AVG(I(VSENSE25N))=0.00410000002011 FROM 0 TO 1e-06
*   ip26: AVG(I(VSENSE26P))=0.00370000000112 FROM 0 TO 1e-06
*   in26: AVG(I(VSENSE26N))=0.00209999992512 FROM 0 TO 1e-06
*   ip27: AVG(I(VSENSE27P))=0.00310000008903 FROM 0 TO 1e-06
*   in27: AVG(I(VSENSE27N))=0.00329999998212 FROM 0 TO 1e-06
*   ip28: AVG(I(VSENSE28P))=0.00300000002608 FROM 0 TO 1e-06
*   in28: AVG(I(VSENSE28N))=0.00289999996312 FROM 0 TO 1e-06
*   ip29: AVG(I(VSENSE29P))=0.00249999994412 FROM 0 TO 1e-06
*   in29: AVG(I(VSENSE29N))=0.00419999985024 FROM 0 TO 1e-06
*   ip30: AVG(I(VSENSE30P))=0.00340000004507 FROM 0 TO 1e-06
*   in30: AVG(I(VSENSE30N))=0.00200000009499 FROM 0 TO 1e-06
*   ip31: AVG(I(VSENSE31P))=0.0108000002801 FROM 0 TO 1e-06
*   in31: AVG(I(VSENSE31N))=0 FROM 0 TO 1e-06
*   ip32: AVG(I(VSENSE32P))=0.00260000000708 FROM 0 TO 1e-06
*   in32: AVG(I(VSENSE32N))=0.00410000002011 FROM 0 TO 1e-06
*   ip33: AVG(I(VSENSE33P))=0.00370000000112 FROM 0 TO 1e-06
*   in33: AVG(I(VSENSE33N))=0.00209999992512 FROM 0 TO 1e-06
*   ip34: AVG(I(VSENSE34P))=0.00310000008903 FROM 0 TO 1e-06
*   in34: AVG(I(VSENSE34N))=0.00329999998212 FROM 0 TO 1e-06
*   ip35: AVG(I(VSENSE35P))=0.00300000002608 FROM 0 TO 1e-06
*   in35: AVG(I(VSENSE35N))=0.00289999996312 FROM 0 TO 1e-06
*   ip36: AVG(I(VSENSE36P))=0.00249999994412 FROM 0 TO 1e-06
*   in36: AVG(I(VSENSE36N))=0.00419999985024 FROM 0 TO 1e-06
*   ip37: AVG(I(VSENSE37P))=0.00340000004507 FROM 0 TO 1e-06
*   in37: AVG(I(VSENSE37N))=0.00200000009499 FROM 0 TO 1e-06
*   ip38: AVG(I(VSENSE38P))=0.0108000002801 FROM 0 TO 1e-06
*   in38: AVG(I(VSENSE38N))=0 FROM 0 TO 1e-06
*   ip39: AVG(I(VSENSE39P))=0.00260000000708 FROM 0 TO 1e-06
*   in39: AVG(I(VSENSE39N))=0.00410000002011 FROM 0 TO 1e-06
*   ip40: AVG(I(VSENSE40P))=0.00370000000112 FROM 0 TO 1e-06
*   in40: AVG(I(VSENSE40N))=0.00209999992512 FROM 0 TO 1e-06
*   ip41: AVG(I(VSENSE41P))=0.00310000008903 FROM 0 TO 1e-06
*   in41: AVG(I(VSENSE41N))=0.00329999998212 FROM 0 TO 1e-06
*   ip42: AVG(I(VSENSE42P))=0.00300000002608 FROM 0 TO 1e-06
*   in42: AVG(I(VSENSE42N))=0.00289999996312 FROM 0 TO 1e-06
*   ip43: AVG(I(VSENSE43P))=0.00249999994412 FROM 0 TO 1e-06
*   in43: AVG(I(VSENSE43N))=0.00419999985024 FROM 0 TO 1e-06
*   ip44: AVG(I(VSENSE44P))=0.00340000004507 FROM 0 TO 1e-06
*   in44: AVG(I(VSENSE44N))=0.00200000009499 FROM 0 TO 1e-06
*   ip45: AVG(I(VSENSE45P))=0.0108000002801 FROM 0 TO 1e-06
*   in45: AVG(I(VSENSE45N))=0 FROM 0 TO 1e-06
*   ip46: AVG(I(VSENSE46P))=0.00260000000708 FROM 0 TO 1e-06
*   in46: AVG(I(VSENSE46N))=0.00410000002011 FROM 0 TO 1e-06
*   ip47: AVG(I(VSENSE47P))=0.00370000000112 FROM 0 TO 1e-06
*   in47: AVG(I(VSENSE47N))=0.00209999992512 FROM 0 TO 1e-06
*   ip48: AVG(I(VSENSE48P))=0.00310000008903 FROM 0 TO 1e-06
*   in48: AVG(I(VSENSE48N))=0.00329999998212 FROM 0 TO 1e-06
*   ip49: AVG(I(VSENSE49P))=0.00300000002608 FROM 0 TO 1e-06
*   in49: AVG(I(VSENSE49N))=0.00289999996312 FROM 0 TO 1e-06
*   ip50: AVG(I(VSENSE50P))=0.00249999994412 FROM 0 TO 1e-06
*   in50: AVG(I(VSENSE50N))=0.00419999985024 FROM 0 TO 1e-06
*   ip51: AVG(I(VSENSE51P))=0.00340000004507 FROM 0 TO 1e-06
*   in51: AVG(I(VSENSE51N))=0.00200000009499 FROM 0 TO 1e-06
*   ip52: AVG(I(VSENSE52P))=0.0108000002801 FROM 0 TO 1e-06
*   in52: AVG(I(VSENSE52N))=0 FROM 0 TO 1e-06
*   ip53: AVG(I(VSENSE53P))=0.00260000000708 FROM 0 TO 1e-06
*   in53: AVG(I(VSENSE53N))=0.00410000002011 FROM 0 TO 1e-06
*   ip54: AVG(I(VSENSE54P))=0.00370000000112 FROM 0 TO 1e-06
*   in54: AVG(I(VSENSE54N))=0.00209999992512 FROM 0 TO 1e-06
*   ip55: AVG(I(VSENSE55P))=0.00310000008903 FROM 0 TO 1e-06
*   in55: AVG(I(VSENSE55N))=0.00329999998212 FROM 0 TO 1e-06
*   ip56: AVG(I(VSENSE56P))=0.00300000002608 FROM 0 TO 1e-06
*   in56: AVG(I(VSENSE56N))=0.00289999996312 FROM 0 TO 1e-06
*   ip57: AVG(I(VSENSE57P))=0.00249999994412 FROM 0 TO 1e-06
*   in57: AVG(I(VSENSE57N))=0.00419999985024 FROM 0 TO 1e-06
*   ip58: AVG(I(VSENSE58P))=0.00340000004507 FROM 0 TO 1e-06
*   in58: AVG(I(VSENSE58N))=0.00200000009499 FROM 0 TO 1e-06
*   ip59: AVG(I(VSENSE59P))=0.0108000002801 FROM 0 TO 1e-06
*   in59: AVG(I(VSENSE59N))=0 FROM 0 TO 1e-06
*   ip60: AVG(I(VSENSE60P))=0.00260000000708 FROM 0 TO 1e-06
*   in60: AVG(I(VSENSE60N))=0.00410000002011 FROM 0 TO 1e-06
*   ip61: AVG(I(VSENSE61P))=0.00370000000112 FROM 0 TO 1e-06
*   in61: AVG(I(VSENSE61N))=0.00209999992512 FROM 0 TO 1e-06
*   ip62: AVG(I(VSENSE62P))=0.00310000008903 FROM 0 TO 1e-06
*   in62: AVG(I(VSENSE62N))=0.00329999998212 FROM 0 TO 1e-06
*   ip63: AVG(I(VSENSE63P))=0.00300000002608 FROM 0 TO 1e-06
*   in63: AVG(I(VSENSE63N))=0.00289999996312 FROM 0 TO 1e-06
*   ip64: AVG(I(VSENSE64P))=0.00249999994412 FROM 0 TO 1e-06
*   in64: AVG(I(VSENSE64N))=0.00419999985024 FROM 0 TO 1e-06